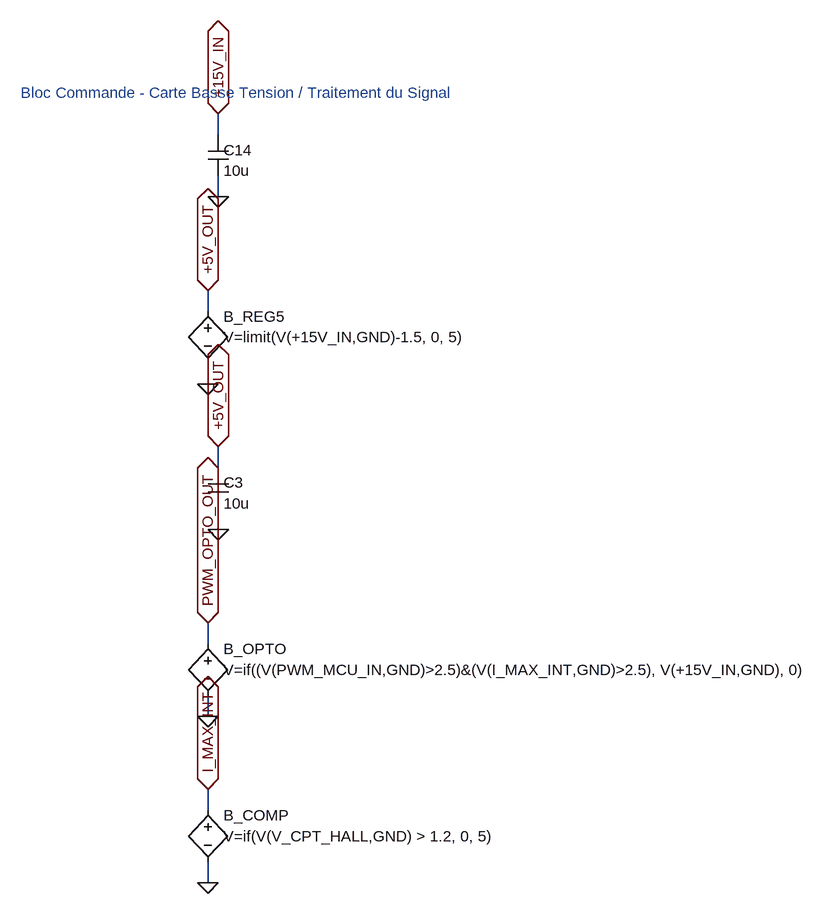
[diagram p0: schematic bloc_commande.asc]
bloc_commande.asc, the LTspice schematic file:
Version 4
SHEET 1 3200 2400
TEXT 32 32 Left 2 ;Bloc Commande - Carte Basse Tension / Traitement du Signal
SYMBOL cap 320 96 R0
WINDOW 0 24 24 Left 2
WINDOW 3 24 56 Left 2
SYMATTR InstName C14
SYMATTR Value 10u
WIRE 336 96 336 64
FLAG 336 64 +15V_IN
IOPIN 336 64 BiDir
WIRE 336 160 336 192
FLAG 336 192 0
IOPIN 336 192 BiDir
SYMBOL bv 320 352 R0
WINDOW 0 24 24 Left 2
WINDOW 3 24 56 Left 2
SYMATTR InstName B_REG5
SYMATTR Value V=limit(V(+15V_IN,GND)-1.5, 0, 5)
WIRE 320 368 320 336
FLAG 320 336 +5V_OUT
IOPIN 320 336 BiDir
WIRE 320 448 320 480
FLAG 320 480 0
IOPIN 320 480 BiDir
SYMBOL cap 320 608 R0
WINDOW 0 24 24 Left 2
WINDOW 3 24 56 Left 2
SYMATTR InstName C3
SYMATTR Value 10u
WIRE 336 608 336 576
FLAG 336 576 +5V_OUT
IOPIN 336 576 BiDir
WIRE 336 672 336 704
FLAG 336 704 0
IOPIN 336 704 BiDir
SYMBOL bv 320 864 R0
WINDOW 0 24 24 Left 2
WINDOW 3 24 56 Left 2
SYMATTR InstName B_OPTO
SYMATTR Value V=if((V(PWM_MCU_IN,GND)>2.5)&(V(I_MAX_INT,GND)>2.5), V(+15V_IN,GND), 0)
WIRE 320 880 320 848
FLAG 320 848 PWM_OPTO_OUT
IOPIN 320 848 BiDir
WIRE 320 960 320 992
FLAG 320 992 0
IOPIN 320 992 BiDir
SYMBOL bv 320 1120 R0
WINDOW 0 24 24 Left 2
WINDOW 3 24 56 Left 2
SYMATTR InstName B_COMP
SYMATTR Value V=if(V(V_CPT_HALL,GND) > 1.2, 0, 5)
WIRE 320 1136 320 1104
FLAG 320 1104 I_MAX_INT
IOPIN 320 1104 BiDir
WIRE 320 1216 320 1248
FLAG 320 1248 0
IOPIN 320 1248 BiDir

The netlist it stands for:
* bloc_commande.asc
C14 +15V_IN 0 10u
B_REG5 +5V_OUT 0 V=limit(V(+15V_IN,GND)-1.5, 0, 5)
C3 +5V_OUT 0 10u
B_OPTO PWM_OPTO_OUT 0 V=if((V(PWM_MCU_IN,GND)>2.5)&(V(I_MAX_INT,GND)>2.5), V(+15V_IN,GND), 0)
B_COMP I_MAX_INT 0 V=if(V(V_CPT_HALL,GND) > 1.2, 0, 5)
* Bloc Commande - Carte Basse Tension / Traitement du Signal
.backanno
.end